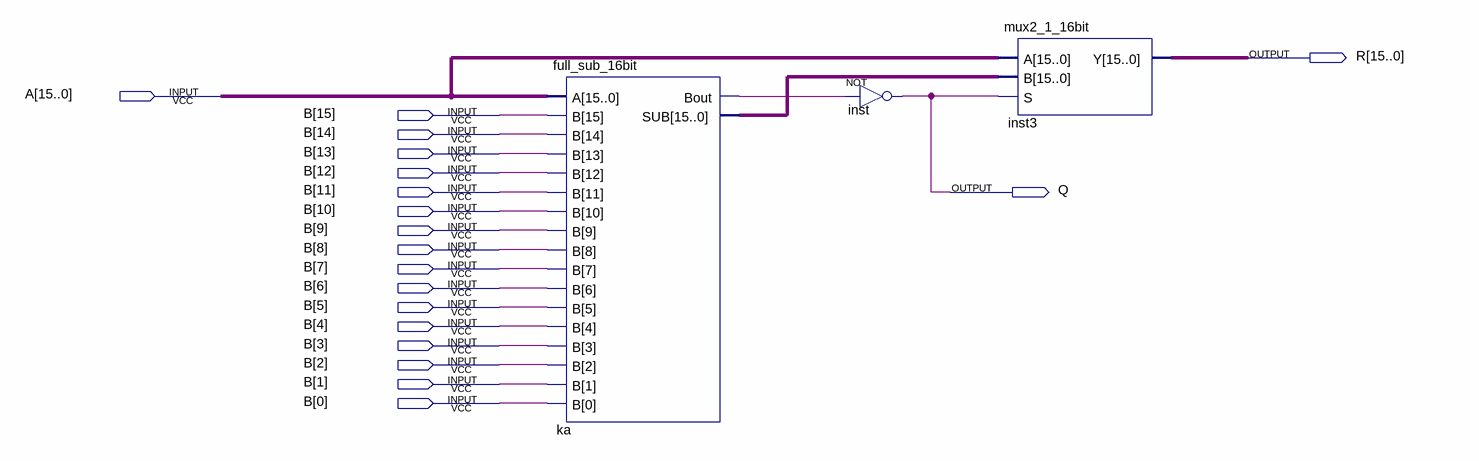
[diagram p0: schematic sheet]
// Quartus schematic mach_chia_1.bdf as structural Verilog: 3 symbols, 19 pins
module mach_chia_1 (
  input  [15:0] A,
  input  [15:0] B,
  output [15:0] R,
  output Q
);

  wire ka_bout;
  wire [15:0] ka_sub;

  full_sub_16bit ka (.A(A), .B(B), .Bout(ka_bout), .SUB(ka_sub));
  not inst (Q, ka_bout);
  mux2_1_16bit inst3 (.A(A), .B(ka_sub), .S(Q), .Y(R));
endmodule
